# EasyEDA Pro project li-chuang-kai-fa-ban-li-chuang-gd32vw553-kai-fa-ban-b5ed9764.epro

# Schematic 立创 · GD32VW553开发板原理图
Board Name: 立创 · GD32VW553开发板; Create Date: 2025-06-09; Page Name: Core; Project Name: 立创 · GD32VW553开发板; Schematic Name: 立创 · GD32VW553开发板原理图; Update Date: 2025-06-09; Company: 嘉立创EDA; Drawed: 立创开发板; Page Size: A4; Reviewed: 嘉立创EDA
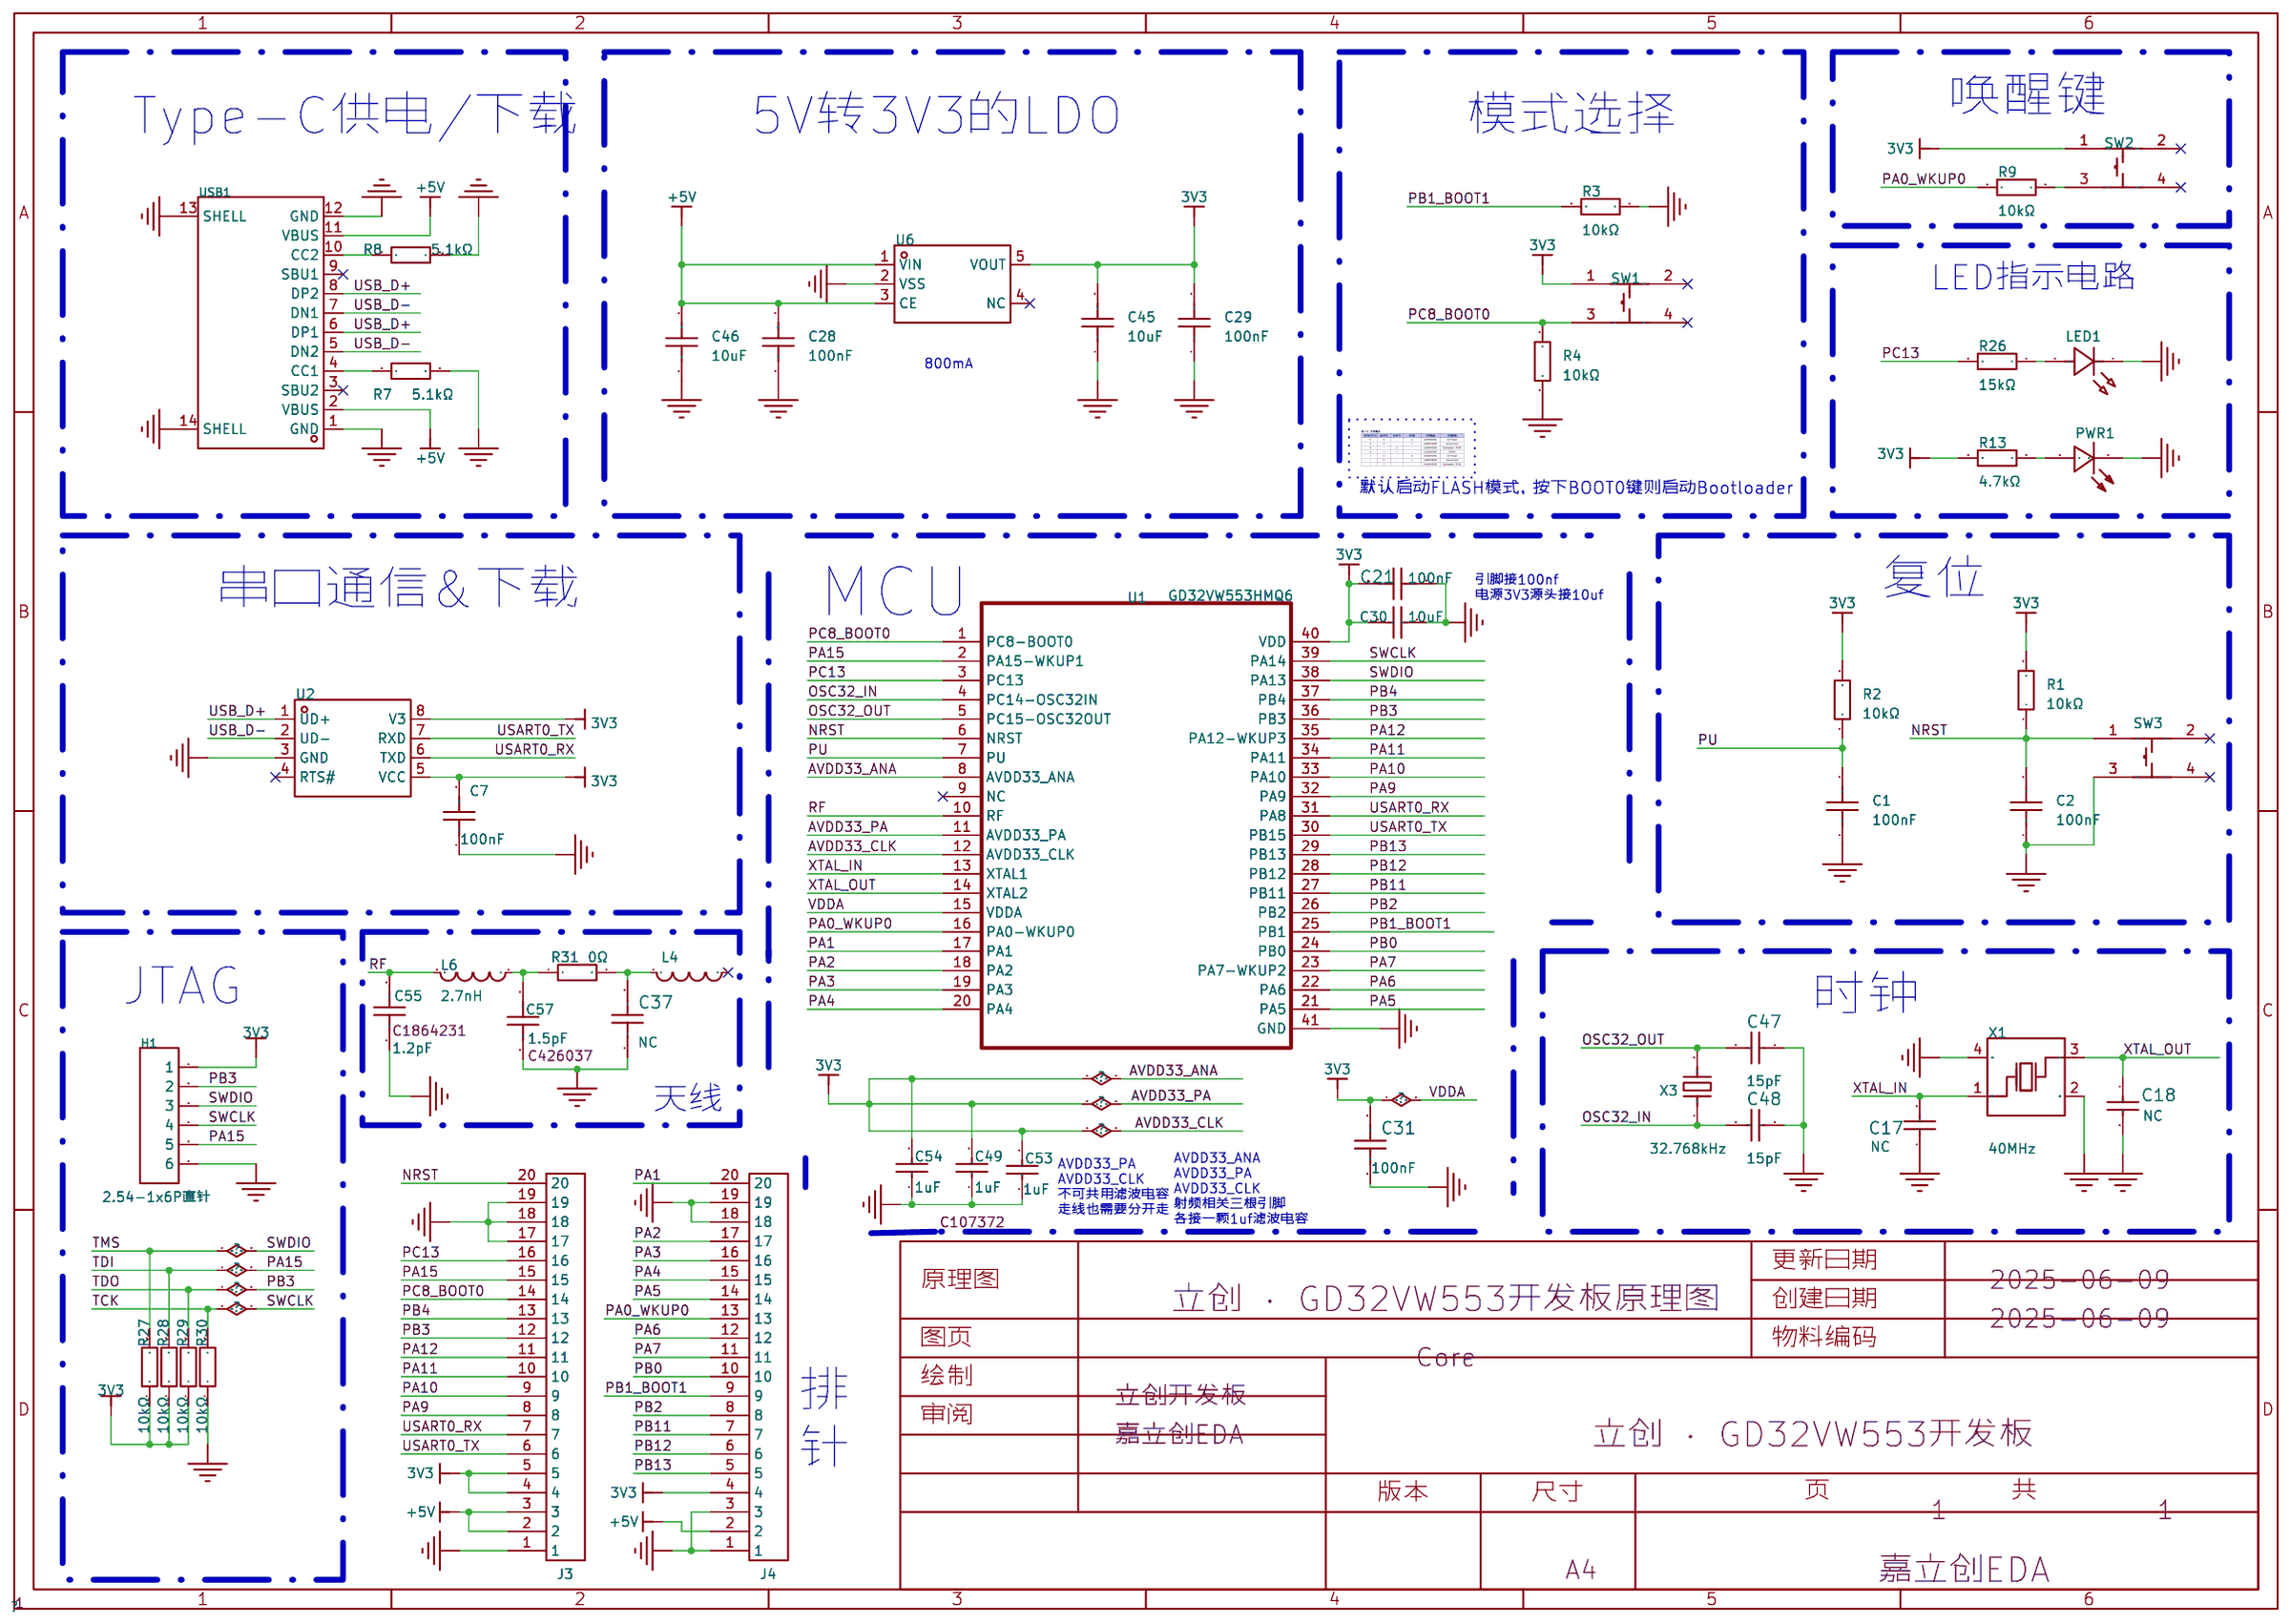
[diagram p0: schematic sheet]

## Parts
C1  100nF  [r0402]
C2  100nF  [r0402]
C7  100nF  [C0603]
C17  NC  [r0402]
C18  NC  [r0402]
C21  100nF  [r0402]
C28  100nF  [r0402]
C29  100nF  [r0402]
C30  10uF  [r0402]
C31  100nF  [r0402]
C37  NC  [C0201]
C45  10uF  [r0402]
C46  10uF  [r0402]
C47  15pF  [r0402]
C48  15pF  [r0402]
C49  1uF  [r0402]
C53  1uF  [r0402]
C54  1uF  [r0402]
C55  1.2pF  [C0201]
C57  1.5pF  [C0201]
H1  2.54-1x6P直针  [HDR-TH_6P-P2.54-V-M-1]
J3  -  [半孔-孔-20p-2.54-1.27-无丝印]
J4  -  [半孔-孔-20p-2.54-1.27-无丝印]
L4  RFANT5220110A2T  [ANT-SMD_L5.2-W2.0]
L6  2.7nH  [L0201]
LED1  XL-1005UGC  [LED0402-RD_GREEN]
PWR1  NCD0402R1  [led0402-rd]
R1  10kΩ  [R0402]
R2  10kΩ  [R0402]
R3  10kΩ  [R0402]
R4  10kΩ  [R0402]
R7  5.1kΩ  [R0603]
R8  5.1kΩ  [R0603]
R9  10kΩ  [R0402]
R13  4.7kΩ  [R0402]
R26  15kΩ  [r0402]
R27  10kΩ  [r0402]
R28  10kΩ  [r0402]
R29  10kΩ  [r0402]
R30  10kΩ  [r0402]
R31  0Ω  [R0201]
SW1  PTS815SJK250SMTRLFS  [SW-SMD_4P-L4.2-W3.3-P2.15-LS5.1]
SW2  PTS815SJK250SMTRLFS  [SW-SMD_4P-L4.2-W3.3-P2.15-LS5.1]
SW3  PTS815SJK250SMTRLFS  [SW-SMD_4P-L4.2-W3.3-P2.15-LS5.1]
U1  GD32VW553HMQ6  [QFN40]
U2  CH340N  [SOP-8_L4.9-W3.9-P1.27-LS6.0-BL]
U6  ME6217C33M5G  [sot-23-5_l3.0-w1.7-p0.95-ls2.8-br]
USB1  TYPE-C 16PIN 2MD(073)  [USB-C-SMD_TYPE-C-6PIN-2MD-073]
X1  40MHz  [CRYSTAL-SMD_4P-L2.5-W2.0-BL]
X3  32.768kHz  [OSC-SMD_L3.2-W1.5]

## Library data of the parts
C1 C2 C28 C29 = CC0402KRX7R7BB104: 容值:100nF;精度:±10%;额定电压:16V;材质(温度系数):X7R;; LCSC Part Name: 100nF ±10% 16V; Supplier Part: C60474; Manufacturer: YAGEO(国巨); Supplier Footprint: 0402; JLCPCB Part Class: Extended Part; Datasheet: https://atta.szlcsc.com/upload/public/pdf/source/20211223/9278FD768280B81DDBEF48FA36411A03.pdf; Supplier: LCSC; Tolerance: ±10%; Voltage Rated: 16V; Temperature Coefficient: X7R
C7 = CC0603KRX7R9BB104: 容值:100nF;精度:±10%;额定电压:50V;材质(温度系数):X7R;; LCSC Part Name: 100nF ±10% 50V; Supplier Part: C14663; Manufacturer: YAGEO(国巨); Supplier Footprint: 0603; JLCPCB Part Class: 基础库; Datasheet: https://atta.szlcsc.com/upload/public/pdf/source/20180910/C282072_33301C7F631E79921B82A8DAC6BCC5B3.pdf; Supplier: LCSC; Tolerance: ±10%; Voltage Rated: 50V; Temperature Coefficient: X7R
C17 C18 = 0402CG100J500NT: 容值:10pF;精度:±5%;额定电压:50V;材质(温度系数):C0G;; LCSC Part Name: 10pF ±5% 50V; Supplier Part: C1545; Manufacturer: FH(风华); Supplier Footprint: 0402; JLCPCB Part Class: Extended Part; Supplier: LCSC; Tolerance: ±5%; Voltage Rated: 50V; Temperature Coefficient: C0G
C21 C31 = GRM155R71H104KE14D: 容值:100nF;精度:±10%;额定电压:50V;材质(温度系数):X7R;; LCSC Part Name: 100nF ±10% 50V; Supplier Part: C77020; Manufacturer: muRata(村田); Supplier Footprint: 0402; JLCPCB Part Class: 扩展库; Datasheet: https://atta.szlcsc.com/upload/public/pdf/source/20180326/C77020_39BD49C951FF1AF0DB1F1FAC5AC1E401.pdf; Supplier: LCSC; Tolerance: ±10%; Voltage Rated: 50V; Temperature Coefficient: X7R
C30 = CL05A106MQ5NUNC: 容值:10uF;精度:±20%;额定电压:6.3V;材质(温度系数):X5R;; LCSC Part Name: 10uF ±20% 6.3V; Supplier Part: C15525; Manufacturer: SAMSUNG(三星); Supplier Footprint: 0402; JLCPCB Part Class: 基础库; Datasheet: https://atta.szlcsc.com/upload/public/pdf/source/20220823/2B02EE04F8F211D38A52DCB16EB6BEBA.pdf; Supplier: LCSC; Tolerance: ±20%; Voltage Rated: 6.3V; Temperature Coefficient: X5R
C37 = GRM0335C1H1R5BA01D: 容值:1.5pF;额定电压:50V;材质(温度系数):C0G;; LCSC Part Name: 1.5pF 50V; Supplier Part: C161414; Manufacturer: muRata(村田); Supplier Footprint: 0201; JLCPCB Part Class: Extended Part; Datasheet: https://atta.szlcsc.com/upload/public/pdf/source/20180122/C161414_15166126300931291272.pdf; Supplier: LCSC; Voltage Rated: 50V; Temperature Coefficient: C0G
C45 C46 = GRM155R61A106ME44D: 容值:10uF;精度:±20%;额定电压:10V;材质(温度系数):X5R;; LCSC Part Name: 10uF ±20% 10V; Supplier Part: C77000; Manufacturer: muRata(村田); Supplier Footprint: 0402; JLCPCB Part Class: 扩展库; Datasheet: https://atta.szlcsc.com/upload/public/pdf/source/20180530/C77000_4866797CFE3A842CD03C597EBD6AE6CD.pdf; Supplier: LCSC; Tolerance: ±20%; Voltage Rated: 10V; Temperature Coefficient: X5R
C47 C48 = 0402CG150J500NT: 容值:15pF;精度:±5%;额定电压:50V;材质(温度系数):C0G;; LCSC Part Name: 15pF ±5% 50V; Supplier Part: C1548; Manufacturer: FH(风华); Supplier Footprint: 0402; Datasheet: https://atta.szlcsc.com/upload/public/pdf/source/20200305/C486355_26A10D38EF8C2A5C37091D0039909270.pdf; Supplier: LCSC; Tolerance: ±5%; Voltage Rated: 50V; Temperature Coefficient: C0G
C49 C53 C54 = CL05A105KQ5NNNC: 容值:1uF;精度:±10%;额定电压:6.3V;材质(温度系数):X5R;; LCSC Part Name: 1uF ±10% 6.3V; Supplier Part: C107372; Manufacturer: SAMSUNG(三星); Supplier Footprint: 0402; JLCPCB Part Class: 扩展库; Datasheet: https://atta.szlcsc.com/upload/public/pdf/source/20170413/1492062766541.pdf; Supplier: LCSC; Tolerance: ±10%; Voltage Rated: 6.3V; Temperature Coefficient: X5R
C55 = GJM0335C1H1R2WB01D: 容值:1.2pF;额定电压:50V;温度系数:C0G;; LCSC Part Name: ±0.05pF 1.2pF 50V; Supplier Part: C1864231; Manufacturer: muRata(村田); Supplier Footprint: 0201; JLCPCB Part Class: 扩展库; Datasheet: https://atta.szlcsc.com/upload/public/pdf/source/20210503/69FEFD345367A6ED6565135E0189A381.pdf; Supplier: LCSC; Voltage Rating: 50V; Temperature Coefficient: C0G
C57 = GJM0335C1E1R5CB01D: 容值:1.5pF;额定电压:25V;温度系数:C0G;; LCSC Part Name: ±0.25pF 1.5pF 25V; Supplier Part: C426037; Manufacturer: muRata(村田); Supplier Footprint: 0201; JLCPCB Part Class: 扩展库; Datasheet: https://atta.szlcsc.com/upload/public/pdf/source/20241220/D0AFAF126C1929700C0BCD7972400352.pdf; Supplier: LCSC; Voltage Rating: 25V; Temperature Coefficient: C0G
H1 = 2.54-1x6P直针: 排数:单排;总PIN位数:6;间距:2.54mm;插针结构:1x6P;行距:-;安装类型:直插;圆针/方针:方针;额定电流:3A;额定电压:-;配合针长度:-;塑高:-;触头材质:黄铜;触头镀层:-;工作温度范围:-40℃~+105℃;颜色:黑色;; LCSC Part Name: 2.54mm 1x6P 直插 方针; Supplier Part: C37208; Manufacturer: BOOMELE(博穆精密); Supplier Footprint: 直插,P=2.54mm; Supplier: LCSC; Number of Rows: 单排; Number of Pins: 6; Pitch: 2.54mm; Pin Structure: 1x6P; Mounting Type: 直插; Circluar Pins/Square Pins: 方针; Current Rating (Max): 3A; Contact Material: 黄铜; Operating Temperature Range: -40℃~+105℃; Color: 黑色
J3 J4 = 半孔-孔-20P-2.54-1.27-无丝印
L4 = RFANT5220110A2T: 天线类型:2.4G天线;中心频点:2.4GHz;带宽:990MHz;峰值增益:2dBi;驻波比:2;极化方式:线性;功率容量:3W;; Supplier Part: C201761; Manufacturer: Walsin(华新科); Supplier Footprint: SMD,2x5.2mm; JLCPCB Part Class: 扩展库; Datasheet: https://atta.szlcsc.com/upload/public/pdf/source/20180726/C201761_362CD995DDC5DCD6FABE652FDC161BB4.pdf; Supplier: LCSC; Antenna Type: 2.4G天线; Central Frequency: 2.4GHz; Bandwidth: 990MHz; Peak Gain: 2dBi; VSWR: 2; Polarization Type: 线性; Impedance: 50Ω; Power capacity: 3W; Operating Temperature: -40℃~+85℃
L6 = LQP03TN2N7B02D: 电感值:2.7nH;精度:-;额定电流:500mA;饱和电流(Isat):-;直流电阻(DCR):200mΩ;; LCSC Part Name: 2.7nH ±0.1nH; Supplier Part: C98043; Manufacturer: muRata(村田); Supplier Footprint: 0201; JLCPCB Part Class: Extended Part; Datasheet: https://atta.szlcsc.com/upload/public/pdf/source/20200107/C157592_7FF58F85BAEF0D918ADFA12AEC0AEBA8.pdf; Supplier: LCSC; Rated Current: 500mA; DC Resistance (DCR): 200mΩ; Q @ Freq: 14@500MHz; Frequency - Self Resonant: 10GHz
LED1 = XL-1005UGC: 发光颜色:翠绿;主波长:516nm;色温:-;功率:80mW;安装方式:正贴;; LCSC Part Name: 正贴; Supplier Part: C2856703; Manufacturer: XINGLIGHT(成兴光); Supplier Footprint: 0402; JLCPCB Part Class: Extended Part; Datasheet: https://atta.szlcsc.com/upload/public/pdf/source/20221102/FF8D6BC2225363A60A01D46BB802F217.pdf; Supplier: LCSC; Emitted Color: 翠绿; Lens Color: 无色透明; Dominant Wavelength: 516nm; Peak Wavelength: 531nm; Forward Current: 25mA; Power Dissipation: 80mW; Viewing Angle: 120°; Mounting Sytle: 正贴; Operating Temperature: -30℃~+85℃
PWR1 = NCD0402R1: 发光颜色:红灯;; LCSC Part Name: 红灯; Supplier Part: C130719; Manufacturer: 国星光电; Supplier Footprint: 0402; JLCPCB Part Class: Extended Part; Datasheet: https://atta.szlcsc.com/upload/public/pdf/source/20200820/C130719_A72EA5A7FEC83C35856EA0453E4EE775.pdf; Supplier: LCSC; Emitted Color: 红灯
R1-R4 R9 = RC0402FR-0710KL: 电阻类型:厚膜电阻;阻值:10kΩ;精度:±1%;功率:62.5mW;; LCSC Part Name: 10kΩ ±1% 62.5mW; Supplier Part: C60490; Manufacturer: YAGEO(国巨); Supplier Footprint: 0402; JLCPCB Part Class: Extended Part; Datasheet: https://atta.szlcsc.com/upload/public/pdf/source/20170606/1496716515432.pdf; Supplier: LCSC; Type: 厚膜电阻; Tolerance: ±1%; Power(Watts): 62.5mW; Temperature Coefficient: ±100ppm/℃; Overload Voltage (Max): 50V; Operating Temperature Range: -55℃~+155℃
R7 R8 = 0603WAF5101T5E: 电阻类型:厚膜电阻;阻值:5.1kΩ;精度:±1%;功率:100mW;; LCSC Part Name: 5.1kΩ ±1% 100mW; Supplier Part: C23186; Manufacturer: UNI-ROYAL(厚声); Supplier Footprint: 0603; JLCPCB Part Class: 基础库; Datasheet: https://atta.szlcsc.com/upload/public/pdf/source/20200306/C422600_1E6D84923E4A46A82E41ADD87F860B5C.pdf; Supplier: LCSC; Type: 厚膜电阻; Tolerance: ±1%; Power(Watts): 100mW; Temperature Coefficient: ±100ppm/℃; Overload Voltage (Max): 75V; Operating Temperature Range: -55℃~+155℃
R13 = 0402WGJ0472TCE: 电阻类型:厚膜电阻;阻值:4.7kΩ;精度:±5%;功率:62.5mW;; LCSC Part Name: 4.7kΩ ±5% 62.5mW; Supplier Part: C25940; Manufacturer: UNI-ROYAL(厚声); Supplier Footprint: 0402; JLCPCB Part Class: 扩展库; Datasheet: https://atta.szlcsc.com/upload/public/pdf/source/20200306/C422600_1E6D84923E4A46A82E41ADD87F860B5C.pdf; Supplier: LCSC; Type: 厚膜电阻; Tolerance: ±5%; Power(Watts): 62.5mW; Temperature Coefficient: ±100ppm/℃; Overload Voltage (Max): 50V; Operating Temperature Range: -55℃~+155℃
R26 = 0402WGF1502TCE: 电阻类型:厚膜电阻;阻值:15kΩ;精度:±1%;功率:62.5mW;; LCSC Part Name: 15kΩ ±1% 62.5mW; Supplier Part: C25756; Manufacturer: UNI-ROYAL(厚声); Supplier Footprint: 0402; JLCPCB Part Class: Basic Part; Datasheet: https://atta.szlcsc.com/upload/public/pdf/source/20200306/C422600_1E6D84923E4A46A82E41ADD87F860B5C.pdf; Supplier: LCSC; Type: 厚膜电阻; Tolerance: ±1%; Power(Watts): 62.5mW; Temperature Coefficient: ±100ppm/℃; Overload Voltage (Max): 50V; Operating Temperature Range: -55℃~+155℃
R27-R30 = 0402WGF1002TCE: 电阻类型:厚膜电阻;阻值:10kΩ;精度:±1%;功率:62.5mW;温度系数:±100ppm/℃;; LCSC Part Name: 厚膜电阻 10kΩ ±1% 62.5mW; Supplier Part: C25744; Manufacturer: UNI-ROYAL(厚声); Supplier Footprint: 0402; Datasheet: https://atta.szlcsc.com/upload/public/pdf/source/20200306/C422600_1E6D84923E4A46A82E41ADD87F860B5C.pdf; Supplier: LCSC; Type: 厚膜电阻; Tolerance: ±1%; Power(Watts): 62.5mW; Temperature Coefficient: ±100ppm/℃; Overload Voltage (Max): 50V; Operating Temperature Range: -55℃~+155℃
R31 = 0201WMF0000TEE: 电阻类型:厚膜电阻;阻值:0Ω;精度:±1%;功率:50mW;最大工作电压:25V;; LCSC Part Name: 0Ω ±1% 50mW 厚膜电阻; Supplier Part: C473473; Manufacturer: UNI-ROYAL(厚声); Supplier Footprint: 0201; JLCPCB Part Class: Extended Part; Datasheet: https://atta.szlcsc.com/upload/public/pdf/source/20200306/C422600_1E6D84923E4A46A82E41ADD87F860B5C.pdf; Supplier: LCSC; Type: 厚膜电阻; Tolerance: ±1%; Power(Watts): 50mW; Overload Voltage (Max): 25V; Operating Temperature Range: -55℃~+155℃
SW1-SW3 = PTS815SJK250SMTRLFS: 操作寿命10万次，使用温度-20°C 至 70°C,尺寸4.20mmx3.20mmx2.50mm，操作力度2.5N; LCSC Part Name: 轻触开关; Supplier Part: C918859; Manufacturer: CK; Supplier Footprint: SMD; JLCPCB Part Class: Extended Part; Datasheet: https://atta.szlcsc.com/upload/public/pdf/source/20190916/C411883_4F77F16E1D8E48DC707D8949CEE7CF80.pdf; Supplier: LCSC
U1 = GD32VW553: 主控MCU
U2 = CH340N: LCSC Part Name: USB转串口芯片 CH340; Supplier Part: C2977777; Manufacturer: WCH(南京沁恒); Supplier Footprint: SOP-8; JLCPCB Part Class: 扩展库; Datasheet: https://atta.szlcsc.com/upload/public/pdf/source/20220223/82A45E4FF89B3EDCAD50B354450A7EF4.pdf; Supplier: LCSC
U6 = ME6217C33M5G: 输出类型:固定;输出极性:正;最大输入电压:7V;输出电压:3.3V;输出电流:800mA;电源纹波抑制比(PSRR):65dB@(1kHz);; Supplier Part: C427602; Manufacturer: MICRONE(南京微盟); Supplier Footprint: SOT-23-5; JLCPCB Part Class: 扩展库; Datasheet: https://atta.szlcsc.com/upload/public/pdf/source/20190910/C427602_D4B9162A2E9D9EF57C60010DFDECEF37.pdf; Supplier: LCSC; Output Type: 固定; Output Polarity: 正; Number of Outputs: 1; Maximum Input Voltage: 7V; Output Voltage: 3.3V; Dropout Voltage: 180mV@(300mA); Output Current: 800mA; Power Supply Rejection Ratio (PSRR): 65dB@(1kHz)
USB1 = TYPE-C 16PIN 2MD(073): 连接器类型:Type-C;标准:-;公母:母座;触点数量:16;端口数量:1;安装方式:卧贴;额定电流 - 电源:5A;工作温度范围:-25℃~+85℃;; LCSC Part Name: TYPE-C母座 16P 4脚插件带定位柱 不锈钢外壳 2次模顶; Supplier Part: C2765186; Manufacturer: SHOU HAN(首韩); Supplier Footprint: SMD; JLCPCB Part Class: 扩展库; Supplier: LCSC; Connector Type: Type-C; Gender: 母座; Number of Contacts: 16; Number of Ports: 1; Mounting Style: 卧贴; Current Rating - Power (Max): 5A; Operating Temperature Range: -25℃~+85℃
X1 = S2240000101050: 频率:40MHz;频率公差:±10ppm;负载电容:10pF;; LCSC Part Name: 40MHz ±10ppm 内置负载电容:10pF; Supplier Part: C426970; Manufacturer: JGHC(晶光华); Supplier Footprint: SMD2520-4P; JLCPCB Part Class: Extended Part; Datasheet: https://atta.szlcsc.com/upload/public/pdf/source/20191012/C426970_2771A21F294CF3AF1716602854856198.pdf; Supplier: LCSC; Crystal Type: 贴片无源晶振; Frequency Tolerance: ±10ppm; Load Capacitance: 10pF; Equivalent Series Resistance (ESR): 50Ω; Operating Temperature: -40℃~+85℃
X3 = X321532768KGD2SI: 频率:32.768kHz;频率公差:±20ppm;负载电容:12.5pF;; LCSC Part Name: 32.768kHz ±20ppm 12.5pF YST310S; Supplier Part: C620155; Manufacturer: YXC(扬兴晶振); Supplier Footprint: SMD3215-2P; Datasheet: https://atta.szlcsc.com/upload/public/pdf/source/20210329/C620155_E5A74FC0D27C5E9015A8D75DE9484FEA.pdf; Supplier: LCSC; Crystal Type: 贴片无源晶振; Frequency Tolerance: ±20ppm; Load Capacitance: 12.5pF; Operating Temperature: -40℃~+85℃

## Nets
3V3: C7.2 C21.1 C29.2 C30.2 C31.2 C45.2 C49.2 C53.2 C54.2 H1.1 J3.4 J3.5 J4.4 R1.2 R2.2 R13.2 R27.1 R28.1 R29.1 SW1.1 SW2.1 U1.8(AVDD33_ANA) U1.11(AVDD33_PA) U1.12(AVDD33_CLK) U1.15(VDDA) U1.40(VDD) U2.5(VCC) U2.8(V3) U6.5(VOUT)
+5V: C28.2 C46.2 J3.2 J3.3 J4.2 U6.1(VIN) U6.3(CE) USB1.2(VBUS) USB1.11(VBUS)
GND: C1.1 C2.1 C7.1 C17.1 C18.2 C21.2 C28.1 C29.1 C30.1 C31.1 C37.1 C45.1 C46.1 C47.2 C48.2 C49.1 C53.1 C54.1 C55.1 C57.1 H1.6 J3.1 J3.17 J3.18 J3.19 J4.1 J4.3 J4.18 J4.19 LED1.1(K) PWR1.1(K) R3.1 R4.2 R7.2 R8.2 R30.1 SW3.3 U1.41(GND) U2.3(GND) U6.2(VSS) USB1.1(GND) USB1.12(GND) USB1.13(SHELL) USB1.14(SHELL) X1.2(GND) X1.4(GND)
NRST: C2.2 J3.20 R1.1 SW3.1 U1.6(NRST)
OSC32_IN: C48.1 U1.4(PC14-OSC32IN) X3.1
OSC32_OUT: C47.1 U1.5(PC15-OSC32OUT) X3.2
PA0_WKUP0: J4.13 R9.1 U1.16(PA0-WKUP0)
PA1: J4.20 U1.17(PA1)
PA2: J4.17 U1.18(PA2)
PA3: J4.16 U1.19(PA3)
PA4: J4.15 U1.20(PA4)
PA5: J4.14 U1.21(PA5)
PA6: J4.12 U1.22(PA6)
PA7: J4.11 U1.23(PA7-WKUP2)
PA9: J3.8 U1.32(PA9)
PA10: J3.9 U1.33(PA10)
PA11: J3.10 U1.34(PA11)
PA12: J3.11 U1.35(PA12-WKUP3)
PA15: H1.5 J3.15 R28.2 U1.2(PA15-WKUP1)
PB0: J4.10 U1.24(PB0)
PB1_BOOT1: J4.9 R3.2 U1.25(PB1)
PB2: J4.8 U1.26(PB2)
PB3: H1.2 J3.12 R29.2 U1.36(PB3)
PB4: J3.13 U1.37(PB4)
PB11: J4.7 U1.27(PB11)
PB12: J4.6 U1.28(PB12)
PB13: J4.5 U1.29(PB13)
PC8_BOOT0: J3.14 R4.1 SW1.3 U1.1(PC8-BOOT0)
PC13: J3.16 R26.2 U1.3(PC13)
PU: C1.2 R2.1 U1.7(PU)
RF: C55.2 L6.2 U1.10(RF)
SWCLK: H1.4 R30.2 U1.39(PA14)
SWDIO: H1.3 R27.2 U1.38(PA13)
USART0_RX: J3.7 U1.31(PA8) U2.6(TXD)
USART0_TX: J3.6 U1.30(PB15) U2.7(RXD)
USB_D+: U2.1(UD+) USB1.6(DP1) USB1.8(DP2)
USB_D-: U2.2(UD-) USB1.5(DN2) USB1.7(DN1)
XTAL_IN: C17.2 U1.13(XTAL1) X1.1(OSC1)
XTAL_OUT: C18.1 U1.14(XTAL2) X1.3(OSC2)
$1N2903: R8.1 USB1.10(CC2)
$1N2915: R7.1 USB1.4(CC1)
$1N28047: PWR1.2(A) R13.1
$1N28050: LED1.2(A) R26.1
$1N31252: R9.2 SW2.3
$1N47923: C37.2 L4.1 R31.2
$1N51376: C57.2 L6.1 R31.1

Not connected (* = marked no-connect by the designer): L4 2*; SW1 2* 4*; SW2 2* 4*; SW3 2* 4*; U1 9(NC)*; U2 4(RTS#)*; U6 4(NC)*; USB1 3(SBU2)* 9(SBU1)*

## Notes on the sheet
- 唤醒键
- Type-C供电/下载
- 5V转3V3的LDO
- 模式选择
- LED指示电路
- 800mA
- 默认启动FLASH模式，按下BOOT0键则启动Bootloader
- 引脚接100nf
  电源3V3源头接10uf
- 串口通信&下载
- 复位
- MCU
- JTAG
- 时钟
- 天线
- AVDD33_PA
  AVDD33_CLK
  不可共用滤波电容
  走线也需要分开走
- AVDD33_ANA
  AVDD33_PA
  AVDD33_CLK
  射频相关三根引脚
  各接一颗1uf滤波电容
- 排
  针

# Board 立创 · GD32VW553开发板_PCB
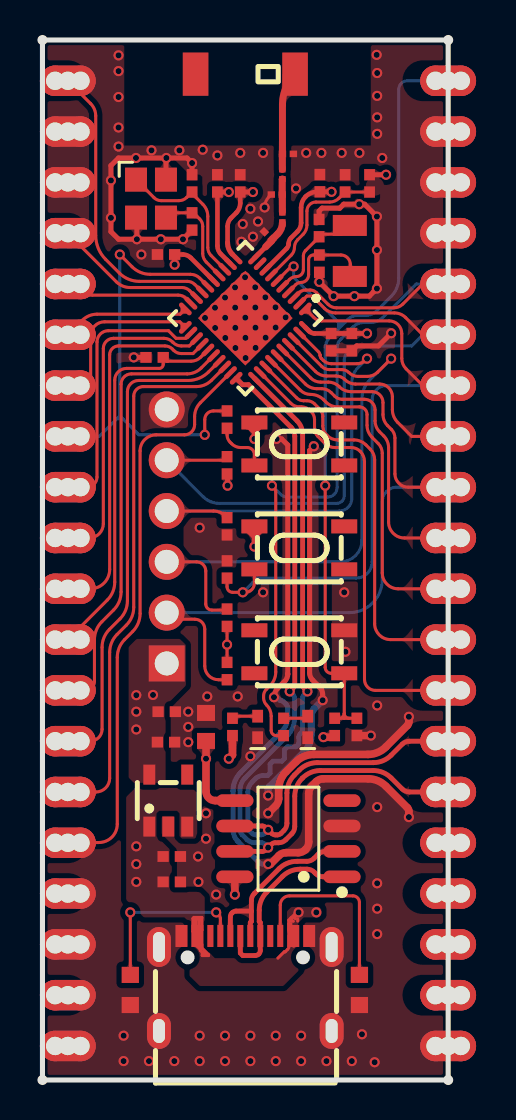
[diagram p1: board, top side]
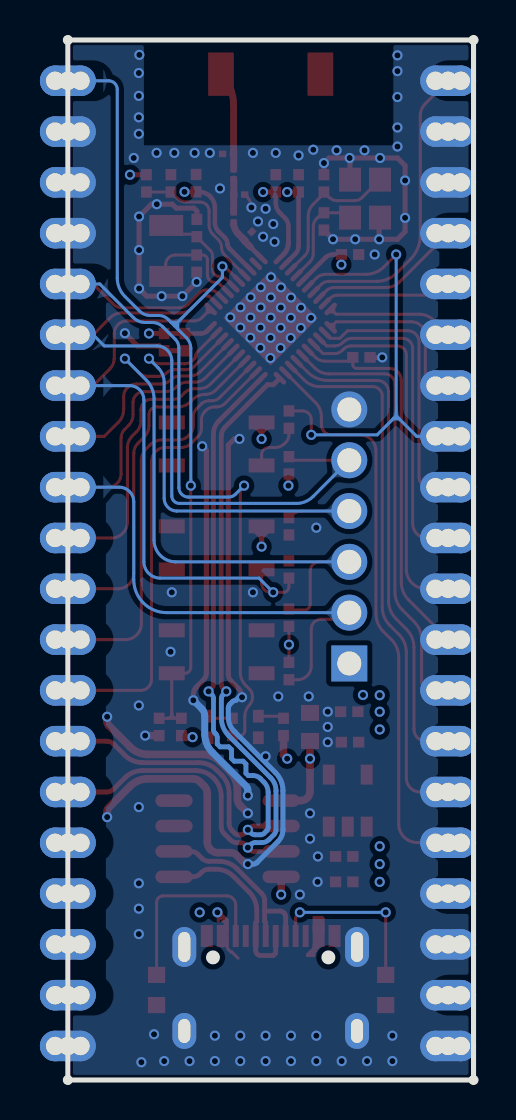
[diagram p2: board, bottom side, seen from below]

Outline 20.32 x 52 mm; copper layers: Top Layer, GND, POWER, Bottom Layer. Coordinates in mm from the lower left corner of the outline.
Outline path: 0,52 0,0 0,0 0,0 20.32,0 20.32,52 0,52
Stack: Top Layer 0.035mm 外层铜厚1oz / Dielectric1 0.2104mm 7628 RC49% 8.6mil / GND 0.0152mm 内层铜厚 / Dielectric2 1.065mm 1.1mm H/HOZ Copper / POWER 0.0152mm 内层铜厚 / Dielectric3 0.2104mm 7628 RC49% 8.6mil / Bottom Layer 0.035mm 外层铜厚1oz

## Design rules (mm)
net USB_D-: DP1
net USB_D+: DP1
net USART0_TX: DP2
net USART0_RX: DP2
spacing copperThickness1oz (default): track to track 0.102, other pairs 0 to 0.3
spacing copperThickness2oz: track to track 0.203, other pairs 0.152 to 0.3
spacing Plane_innerPlane: track to track 0.102, other pairs 0 to 0.3
spacing Copper_copperRegion: track to track 0.102, other pairs 0 to 0.3
track width copperThickness1oz (default): min 0.152, default 0.152, max 2.54
track width copperThickness2oz: min 0.203, default 0.254, max 2.54
differential pair differentialPair (default): width min 0.241, default 0.241, max 0.241; gap min 0.152, default 0.152
region e1 uses Copper_copperRegion
pour e1160 uses Copper_copperRegion
pour e1166 uses Copper_copperRegion
pour e1168 uses Copper_copperRegion
pour e1170 uses Copper_copperRegion
pour e1189 uses Copper_copperRegion

## Placement (name value [footprint] x y rotation side)
C1  100nF  [r0402]  15.16 44.83 270 top
C2  100nF  [r0402]  15.75 17.65 90 top
C7  100nF  [C0603]  8.19 17.65 270 top
C17  NC  [r0402]  7.49 44.83 270 top
C18  NC  [r0402]  7.49 42.93 270 top
C21  100nF  [r0402]  15.49 36.89 270 top
C28  100nF  [r0402]  6.48 9.91 180 top
C29  100nF  [r0402]  6.22 18.42 180 top
C30  10uF  [r0402]  14.46 36.89 90 top
C31  100nF  [r0402]  6.19 41.28 0 top
C37  NC  [C0201]  12.29 46.3 180 top
C45  10uF  [r0402]  6.19 16.89 180 top
C46  10uF  [r0402]  6.48 11.18 180 top
C47  15pF  [r0402]  13.86 42.6 90 top
C48  15pF  [r0402]  13.87 40.82 270 top
C49  1uF  [r0402]  9.91 44.83 270 top
C53  1uF  [r0402]  8.76 44.83 270 top
C54  1uF  [r0402]  13.89 44.84 270 top
C55  1.2pF  [C0201]  11.3 42.22 315 top
C57  1.5pF  [C0201]  11.74 44.27 0 top
H1  2.54-1x6P直针  [hdr-th_6p-p2.54-v-m-1]  6.22 27.18 90 top
J3  -  [半孔-孔-20p-2.54-1.27-无丝印]  19.69 25.83 90 top
J4  -  [半孔-孔-20p-2.54-1.27-无丝印]  0.64 25.83 90 top
L4  RFANT5220110A2T  [ant-smd_l5.2-w2.0]  10.16 50.29 180 top
L6  2.7nH  [L0201]  12.01 43.13 270 top
LED1  XL-1005UGC  [LED0402-RD_GREEN]  13.29 17.65 90 top
PWR1  NCD0402R1  [led0402-rd]  10.78 17.65 90 top
R1  10kΩ  [R0402]  14.63 17.65 270 top
R2  10kΩ  [R0402]  16.38 44.83 90 top
R3  10kΩ  [R0402]  5.62 36.13 0 top
R4  10kΩ  [R0402]  9.25 25.53 90 top
R7  5.1kΩ  [R0603]  4.4 4.5 270 top
R8  5.1kΩ  [R0603]  15.88 4.5 270 top
R9  10kΩ  [R0402]  9.25 33.02 270 top
R13  4.7kΩ  [R0402]  9.52 17.65 270 top
R26  15kΩ  [r0402]  12.08 17.65 270 top
R27  10kΩ  [r0402]  9.25 23.11 90 top
R28  10kΩ  [r0402]  9.25 30.73 90 top
R29  10kΩ  [r0402]  9.25 20.45 270 top
R30  10kΩ  [r0402]  9.25 27.69 90 top
R31  0Ω  [R0201]  12.01 45.29 90 top
SW1  PTS815SJK250SMTRLFS  [SW-SMD_4P-L4.2-W3.3-P2.15-LS5.1]  12.87 26.61 0 top
SW2  PTS815SJK250SMTRLFS  [SW-SMD_4P-L4.2-W3.3-P2.15-LS5.1]  12.87 31.8 0 top
SW3  PTS815SJK250SMTRLFS  [SW-SMD_4P-L4.2-W3.3-P2.15-LS5.1]  12.87 21.41 180 top
U1  GD32VW553HMQ6  [qfn40]  10.16 38.09 225 top
U2  CH340N  [SOP-8_L4.9-W3.9-P1.27-LS6.0-BL]  12.32 12.07 90 top
U6  ME6217C33M5G  [sot-23-5_l3.0-w1.7-p0.95-ls2.8-br]  6.3 13.97 270 top
USB1  TYPE-C 16PIN 2MD(073)  [USB-C-SMD_TYPE-C-6PIN-2MD-073]  10.16 4.83 0 top
X1  40MHz  [crystal-smd_4p-l2.5-w2.0-bl]  5.44 44.07 270 top
X3  32.768kHz  [osc-smd_l3.2-w1.5]  15.39 41.45 90 top

## Footprints (pads in the part's own frame, mm; a bottom-side part is the same pattern mirrored in y, then rotated)
ant-smd_l5.2-w2.0
  rect 1.282x2.16 smd: 1(-2.491,0) 2(2.491,0)
C0201
  rect 0.368x0.324 smd: 1(-0.275,0) 2(0.275,0)
C0603
  rect 0.8x0.9 smd: 1(-0.7,0) 2(0.7,0)
crystal-smd_4p-l2.5-w2.0-bl
  rect 1.2x1.1 smd: 1(-0.95,-0.75) 2(0.95,-0.75) 3(0.95,0.75) 4(-0.95,0.75)
hdr-th_6p-p2.54-v-m-1
  rect 1.8x1.8 hole 1.2: 1(-6.35,0)
  round 1.8 hole 1.2: 2(-3.81,0) 3(-1.27,0) 4(1.27,0) 5(3.81,0) 6(6.35,0)
L0201
  rect 0.368x0.324 smd: 1(-0.275,0) 2(0.275,0)
led0402-rd
  rect 0.636x0.54 smd: 1(-0.538,0) 2(0.538,0)
LED0402-RD_GREEN
  rect 0.636x0.54 smd: 1(-0.538,0) 2(0.538,0)
osc-smd_l3.2-w1.5
  rect 1.05x1.7 smd: 1(-1.275,0) 2(1.275,0)
qfn40
  oval 0.8x0.24 smd: 1(-2.45,1.8) 2(-2.45,1.4) 3(-2.45,1) 4(-2.45,0.6) 5(-2.45,0.2) 6(-2.45,-0.2) 7(-2.45,-0.6) 8(-2.45,-1) 9(-2.45,-1.4) 10(-2.45,-1.8) 21(2.45,-1.8) 22(2.45,-1.4) 23(2.45,-1) 24(2.45,-0.6) 25(2.45,-0.2) 26(2.45,0.2) 27(2.45,0.6) 28(2.45,1) 29(2.45,1.4) 30(2.45,1.8)
  oval 0.24x0.8 smd: 11(-1.8,-2.45) 12(-1.399,-2.45) 13(-1.001,-2.45) 14(-0.6,-2.45) 15(-0.201,-2.45) 16(0.201,-2.45) 17(0.6,-2.45) 18(1.001,-2.45) 19(1.399,-2.45) 20(1.8,-2.45) 31(1.8,2.45) 32(1.399,2.45) 33(1.001,2.45) 34(0.6,2.45) 35(0.201,2.45) 36(-0.201,2.45) 37(-0.6,2.45) 38(-1.001,2.45) 39(-1.399,2.45) 40(-1.8,2.45)
  rect 3.35x3.35 smd: 41(0,0)
R0201
  rect 0.303x0.324 smd: 1(-0.241,0) 2(0.241,0)
r0402
  rect 0.566x0.54 smd: 1(-0.433,0) 2(0.433,0)
R0402
  rect 0.566x0.54 smd: 1(-0.433,0) 2(0.433,0)
R0603
  rect 0.806x0.864 smd: 1(-0.753,0) 2(0.753,0)
SOP-8_L4.9-W3.9-P1.27-LS6.0-BL
  oval 0.63x1.865 smd: 1(-1.905,-2.683) 2(-0.635,-2.683) 3(0.635,-2.683) 4(1.905,-2.683) 5(1.905,2.683) 6(0.635,2.683) 7(-0.635,2.683) 8(-1.905,2.683)
sot-23-5_l3.0-w1.7-p0.95-ls2.8-br
  rect 1x0.6 smd: 1(1.3,-0.95) 2(1.3,0) 3(1.3,0.95) 4(-1.3,0.95) 5(-1.3,-0.95)
SW-SMD_4P-L4.2-W3.3-P2.15-LS5.1
  rect 1.3x0.7 smd: 1(-2.25,1.075) 2(2.25,1.075) 3(-2.25,-1.075) 4(2.25,-1.075)
USB-C-SMD_TYPE-C-6PIN-2MD-073
  rect 0.6x1.1 smd: 1(-3.2,2.375) 2(-2.4,2.375) 11(2.4,2.375) 12(3.2,2.375)
  rect 0.3x1.1 smd: 3(-1.75,2.375) 4(-1.25,2.375) 5(-0.75,2.375) 6(-0.25,2.375) 7(0.25,2.375) 8(0.75,2.375) 9(1.25,2.375) 10(1.75,2.375)
  oval 1.2x2 hole 0.6x1.5: 13(-4.325,1.825) 14(4.325,1.825)
  oval 1.2x1.8 hole 0.6x1.2: 13(-4.325,-2.375) 14(4.325,-2.375)
半孔-孔-20p-2.54-1.27-无丝印
  round 1.524 hole 0.914: 1(-24.13,0) 1(-24.13,-1.27) 2(-21.59,0) 2(-21.59,-1.27) 3(-19.05,0) 3(-19.05,-1.27) 4(-16.51,0) 4(-16.51,-1.27) 5(-13.97,0) 5(-13.97,-1.27) 6(-11.43,0) 6(-11.43,-1.27) 7(-8.89,0) 7(-8.89,-1.27) 8(-6.35,0) 8(-6.35,-1.27) 9(-3.81,0) 9(-3.81,-1.27) 10(-1.27,0) 10(-1.27,-1.27) 11(1.27,0) 11(1.27,-1.27) 12(3.81,0) 12(3.81,-1.27) 13(6.35,0) 13(6.35,-1.27) 14(8.89,0) 14(8.89,-1.27) 15(11.43,0) 15(11.43,-1.27) 16(13.97,0) 16(13.97,-1.27) 17(16.51,0) 17(16.51,-1.27) 18(19.05,0) 18(19.05,-1.27) 19(21.59,0) 19(21.59,-1.27) 20(24.13,0) 20(24.13,-1.27)
  oval 1.524x2.794 hole 0.914: 1(-24.13,-0.635) 2(-21.59,-0.635) 3(-19.05,-0.635) 4(-16.51,-0.635) 5(-13.97,-0.635) 6(-11.43,-0.635) 7(-8.89,-0.635) 8(-6.35,-0.635) 9(-3.81,-0.635) 10(-1.27,-0.635) 11(1.27,-0.635) 12(3.81,-0.635) 13(6.35,-0.635) 14(8.89,-0.635) 15(11.43,-0.635) 16(13.97,-0.635) 17(16.51,-0.635) 18(19.05,-0.635) 19(21.59,-0.635) 20(24.13,-0.635)

## Nets
As in the schematic.

Pads without a net: L4 2; SW1 2 4; SW2 2 4; SW3 2 4; U1 9; U2 4; U6 4; USB1 3 9

## Via types
v1: diameter 0.508, hole 0.305, Top Layer to Bottom Layer, 156 vias

## Routing (per net, layer and track width the routed paths; a pad name or vN(x,y) marks a point on that pad's centre or on a via; arc(x,y) is an arc through that point)
3V3: length 160.9
  Top Layer w0.152: 9.51,41.29 U1.11 ; R29.1 v1(9.25,21.77) 9.25,22.68
  Top Layer w0.229: 13.89,44.41 13.76,44.41 arc(13.45,44.35) 13.18,44.17 arc(13.01,43.92) 12.95,43.62 12.95,42.86 arc(12.91,42.63) 12.78,42.43 12.44,42.1 arc(12.36,41.97) 12.33,41.82 arc(12.33,41.8) 12.33,41.79 arc(12.3,41.67) 12.23,41.58 U1.8 ; C49.2 9.91,43.84 arc(9.86,43.58) 9.71,43.37 9.44,43.1 arc(9.32,42.91) 9.27,42.68 9.27,41.87 ; U1.12 8.93,41.3 arc(8.81,41.49) 8.76,41.71 C53.2 ; U1.15 7.43,41.11 arc(7.24,41.23) 7.03,41.28 C31.2 ; C30.2 13.64,37.33 arc(13.49,37.36) 13.36,37.44 U1.40
  Top Layer w0.241: v1(16.26,37.33) C21.1 C30.2
  Top Layer w0.254: v1(10.62,26.67) 10.62,27.15 ; 10.62,27.15 10.29,27.48 10.17,27.48 ; 10.62,27.15 10.95,27.49 11.06,27.49 ; 10.62,27.15 SW1.1 ; C31.2 v1(6.62,40.77) ; 10.62,32.39 10.9,32.67 11.07,32.67 ; 10.62,32.39 v1(10.62,32.05) ; 10.62,32.39 10.35,32.66 10.25,32.66 ; 10.62,32.39 SW2.1 ; v1(9.27,29.72) 9.27,30.28 R28.1 ; C53.2 v1(9.33,44.4) ; R2.2 v1(17.21,45.26) ; 13.89,44.41 v1(14.48,44.41) ; C49.2 v1(10.54,44.4) ; 9.27,41.87 arc(9.33,41.55) 9.51,41.29
  Top Layer w0.381: R13.2 9.52,16.25 v1(9.33,16.07) ; R1.2 14.56,17.14 v1(14.07,17.14) ; U2.5 8.65,13.97 arc(8.33,14.1) 8.19,14.43 v1(8.19,16.07) C7.2 ; U2.8 v1(9.64,9.27)
  POWER w0.381: 10.03,45.21 10.2,45.21 10.54,44.87 ; 13.82,15.73 13.34,15.24 ; 13.82,15.73 14.07,15.98 v1(14.07,17.14) ; 13.82,15.73 13.82,14.81 13.8,14.78 ; 9.33,15.76 9.33,15.25 9.34,15.24 ; 9.33,15.76 9.85,15.24 ; 9.33,15.76 9.33,15.79 ; 14.48,44.87 14.48,45.4 14.48,45.41 ; 14.48,44.87 14.14,45.21 13.97,45.21 ; 14.48,44.87 v1(14.48,44.41) ; 14.48,44.87 14.99,45.38 14.99,45.41 ; 14.43,30.73 10.29,30.73 v1(9.27,29.72) ; 14.43,30.73 14.99,30.18 ; 14.43,30.73 14.99,30.73 ; 14.43,30.73 14.99,31.29 ; 5.08,19.18 5.46,19.18 v1(5.54,19.25) ; 9.25,21.47 8.86,21.08 ; 9.25,21.47 9.63,21.08 ; 9.25,21.47 v1(9.25,21.77) ; 9.25,21.47 9.25,20.84 9.23,20.83 ; 9.33,44.8 9.33,45.15 9.27,45.21 ; 9.33,44.8 9.73,45.2 9.73,45.41 ; 9.33,44.8 8.97,45.17 8.97,45.41 ; 9.33,44.8 v1(9.33,44.4) ; 16.92,44.97 16.4,44.97 16.23,44.81 ; 16.92,44.97 16.51,44.56 16.48,44.56 ; 16.92,44.97 16.92,44.24 16.86,44.18 ; 16.92,44.97 v1(17.21,45.26) ; 5.11,19.72 5.11,19.68 v1(5.54,19.25) ; 14.55,32.7 14.99,32.26 ; 14.55,32.7 15.24,32.7 ; 14.55,32.7 11.26,32.7 v1(10.62,32.05) ; 14.55,32.7 14.99,33.13 ; 9.64,14.66 9.64,15.24 9.64,15.24 ; 9.64,14.66 10.21,15.24 ; 9.64,14.66 9.64,14.63 ; v1(5.54,19.25) 5.54,20.14 ; v1(8.19,16.07) 8.19,15.71 ; 8.19,15.71 8.66,15.24 ; 8.19,15.71 7.72,15.24 ; 8.19,15.71 8.19,15.25 8.2,15.24 ; v1(10.62,26.67) 13.12,26.67 ; 13.12,26.67 13.81,26.67 13.84,26.64 ; 13.12,26.67 13.59,26.2 ; 13.12,26.67 13.73,27.28 ; 9.33,15.79 8.79,15.24 ; 9.33,15.79 v1(9.33,16.07) ; 10.54,44.87 v1(10.54,44.4) ; 10.54,44.87 11.05,45.38 11.05,45.41 ; 10.54,44.87 10.54,45.4 10.55,45.41 ; v1(9.64,9.27) 9.64,14.63 ; 9.64,14.63 9.03,15.24
  POWER w0.762: 19.05,9.32 19.05,11.86 16.71,11.86 13.34,15.24 4.7,15.24 ; 15.24,36.07 15.24,36.31 v1(16.26,37.33) 17.61,38.68 17.61,43.43 16.86,44.18 16.48,44.56 16.23,44.81 15.63,45.41 8.45,45.41 8,44.96 8,41.78 6.99,40.77 v1(6.62,40.77) ; J4.4 3.3,11.35 3.3,13.84 4.7,15.24 ; 4.7,15.24 v1(4.7,17.53) v1(4.7,18.42) v1(4.7,19.24) 4.7,19.3 5.11,19.72 5.54,20.14 H1.1
  POWER w1.016: H1.1 12.45,20.83 13.84,22.23 13.84,26.92 15.24,28.32 15.24,36.07
+5V: length 48.7
  Top Layer w0.152: 12.78,8.34 12.66,8.22 12.66,8.06 ; 7.71,6.71 7.72,6.71 7.91,6.52 7.91,6.48 8,6.38 ; 12.57,8.15 12.49,8.06 12.45,8.1 ; 12.45,8.1 12.34,7.99 12.34,7.8 ; 12.45,8.1 12.73,8.38 12.8,8.38 ; 7.93,6.81 7.93,6.66 7.98,6.6 ; 7.97,7.48 7.98,7.5 7.98,8.13 7.59,8.13 ; 7.59,7.37 7.76,7.2 ; 7.59,7.37 7.53,7.43 7.53,8.07 7.59,8.13 ; 7.59,7.37 7.59,8.13 ; 12.35,7.2 12.35,6.71 arc(12.33,6.61) 12.28,6.53 12.16,6.41 12.11,6.41 11.79,6.09 ; 12.59,6.69 12.57,6.69 ; 7.98,6.6 7.98,6.77 ; 7.98,6.6 8.32,6.27 8.32,6.22 8,6.22 8,6.38 ; 12.34,7.8 12.45,7.8 ; 12.34,7.8 12.34,7.53 arc(12.36,7.43) 12.41,7.35 12.56,7.2 ; 12.57,7.94 12.45,7.94 ; 8.14,6.3 8.06,6.38 8,6.38 ; 7.71,7.65 7.71,8.05 7.71,8.05 7.9,8.05 ; 7.9,8.05 7.91,8.06 ; 7.9,8.05 7.86,8.01 7.86,7.66 ; 12.78,7.94 12.78,8.06
  POWER w1.016: 8.91,6.88 7.03,8.76 5.84,8.76 v1(4.7,9.91) v1(4.7,10.8) v1(4.7,11.68) ; 8.91,6.88 8.91,6.07 ; 8.91,6.88 9.71,6.88 ; 8.91,5.06 8.09,4.24 ; 8.91,5.06 8.91,6.07 ; 8.91,5.06 8.91,4.24 ; 8.91,5.06 9.73,4.24 ; 8.09,4.24 8.91,4.24 ; 8.09,4.24 J4.2 ; 8.91,6.07 9.71,6.88 ; 8.91,4.24 9.73,4.24 ; 9.73,4.24 19.05,4.24 19.05,6.78 ; 9.71,6.88 11.22,8.38 v1(12.83,8.38) v1(13.72,8.38)
GND: length 95.5
  Top Layer w0.152: C57.1 11.34,44.16 arc(11.18,43.91) v1(11.13,43.63)
  Top Layer w0.254: X1.2 4.73,43.08 v1(4.73,42.04) ; R3.1 v1(4.57,36.13) ; C30.1 C21.2 15.74,36.7 16.83,36.7 v1(17.46,37.34) ; X1.4 6.19,46.08 v1(6.21,46.1) ; v1(13.59,31.69) 13.38,31.48 13.38,20.36 arc(13.42,20.16) 13.53,20 13.88,19.64 arc(13.99,19.48) 14.03,19.28 v1(14.03,18.99) ; v1(6.21,46.1) v1(4.68,46.1) 3.81,46.1 3.43,45.72 v1(3.43,44.98) v1(3.43,43.11) 3.43,42.42 3.81,42.04 v1(4.73,42.04) ; v1(6.21,46.1) 7.24,46.1 v1(7.49,45.85) C17.1 ; 16.75,42.96 v1(16.75,41.5) 16.75,39.78 arc(16.71,39.59) 16.6,39.42 ; v1(4.73,42.04) v1(5.93,42.04) v1(7.04,42.04) 7.49,42.49 ; 16.6,39.42 v1(16.75,39.57) ; 16.6,39.42 16.37,39.19 v1(15.62,39.19) v1(14.58,39.19) v1(13.87,39.9) C48.2 ; v1(11.72,32.05) 11.98,32.05 12.28,31.75 12.28,20.3 arc(12.28,20.3) 12.29,20.3 arc(12.25,20.1) 12.14,19.94 11.77,19.57 arc(11.66,19.41) 11.62,19.21 11.59,19.19 v1(11.59,19.14) ; 13.86,43.03 13.86,43.45 14,43.59 14.89,43.59 15.09,43.79 v1(15.86,43.79) 16.14,43.79 v1(16.75,43.17)
  Top Layer w0.381: v1(18.35,13.14) 18.35,13.43 arc(18.33,13.53) 18.28,13.61 17.2,14.69 arc(16.79,14.96) 16.3,15.06 14.06,15.06 arc(13.87,15.02) 13.71,14.91 13.48,14.69 arc(13.37,14.53) 13.34,14.33 13.34,11.89 arc(13.3,11.7) 13.19,11.54 13.17,11.52 arc(13,11.41) 12.81,11.37 12.2,11.37 arc(12.01,11.33) 11.84,11.22 11.42,10.8 v1(11.3,10.8) ; v1(11.3,13.34) 11.68,13.71 arc(11.79,13.88) 11.83,14.07 11.83,14.52 arc(11.93,15.01) 12.2,15.42 12.69,15.91 arc(13.1,16.18) 13.59,16.28 16.3,16.28 arc(16.79,16.38) 17.2,16.65 18.28,17.73 arc(18.33,17.81) 18.35,17.91 v1(18.35,18.16) ; C2.1 v1(16.45,17.22)
  Bottom Layer w0.254: v1(11.3,10.8) 11.03,10.8 arc(10.93,10.81) 10.85,10.87 9.8,11.92 arc(9.61,12.2) 9.54,12.53 9.54,14.47 arc(9.64,14.95) 9.92,15.36 11.99,17.44 arc(12.2,17.76) 12.28,18.13 12.28,18.6 arc(12.26,18.7) 12.21,18.78 12.08,18.91 arc(11.99,18.97) 11.9,18.99 11.74,19.14 v1(11.59,19.14)
  Bottom Layer w0.348: v1(14.03,18.99) 13.61,18.56 arc(13.5,18.4) 13.46,18.2 13.46,17.29 arc(13.37,16.8) 13.09,16.39 11.38,14.68 arc(11.32,14.6) 11.3,14.5 v1(11.3,14.22)
  vias: v1(3.81,51.23) v1(3.81,50.44) v1(3.81,49.15) v1(3.81,47.63) v1(3.81,46.67) v1(4.06,2.22) v1(4.06,0.95) v1(4.95,41.28) v1(5.33,0.95) v1(5.46,46.48) v1(6.6,0.95) v1(6.86,46.48) v1(7.3,18.42) v1(7.3,17.65) v1(7.3,16.89) v1(7.87,27.62) v1(7.79,11.18) v1(7.81,9.91) v1(7.87,2.22) v1(7.87,0.95) v1(8.03,46.51) v1(8.14,38.11) v1(8.19,13.34) v1(8.19,12.07) v1(8.25,19.18) v1(8.64,38.61) v1(8.65,37.6) v1(8.76,46.23) v1(8.7,9.27) v1(9.14,39.12) v1(9.15,38.11) v1(9.16,37.1) v1(9.14,2.22) v1(9.14,0.95) v1(9.65,39.63) v1(9.65,38.62) v1(9.66,37.61) v1(9.67,36.6) v1(9.78,19.18) v1(9.91,46.36) v1(9.97,41.91) v1(10.03,42.8) v1(10.15,40.14) v1(10.15,39.13) v1(10.16,38.12) v1(10.17,37.11) v1(10.17,36.1) v1(10.41,43.56) v1(10.41,16.19) v1(10.41,2.22) v1(10.41,0.95) v1(10.54,42.16) v1(10.66,39.64) v1(10.66,38.63) v1(10.67,37.62) v1(10.67,36.61) v1(10.8,42.93) v1(11.05,46.36) v1(11.05,24.38) v1(11.16,39.14) v1(11.17,38.13) v1(11.18,37.12) v1(11.67,38.63) v1(11.68,37.62) v1(11.68,2.22) v1(11.68,0.95) v1(12.18,38.13) v1(12.7,44.58) v1(12.95,2.22) v1(12.95,0.95) v1(13.21,46.36) v1(13.97,46.36) v1(14.22,0.95) v1(14.99,46.36) v1(15.11,24.38) v1(15.17,21.41) v1(15.49,0.95) v1(15.88,46.36) v1(16,2.29) v1(16.64,0.89) v1(16.74,51.26) v1(16.76,50.35) v1(16.76,49.21) v1(16.76,48.13) v1(16.76,47.31) v1(16.76,18.73) v1(16.76,13.65) v1(16.76,9.84) v1(16.76,8.57) v1(16.76,7.3) v1(17.02,46.1)
NRST: length 43.5
  Top Layer w0.152: 15.12,18.09 15.35,18.09 ; 15.12,18.09 R1.1 14.88,18.09 arc(15.05,18.16) 15.12,18.32 ; 15.12,18.09 15.12,18.32 ; 15.35,18.09 15.75,18.09 ; 15.35,18.09 arc(15.18,18.15) 15.12,18.32 ; v1(14.16,29.72) 14.16,20.63 arc(14.25,20.42) 14.46,20.34 SW3.1 15.12,18.32 ; 11.75,39.97 12.46,40.68 v1(12.58,40.68)
  Bottom Layer w0.152: 19.05,49.96 18.28,49.96 arc(17.97,49.83) 17.84,49.52 17.84,40.1 arc(17.74,39.6) 17.46,39.18 16.73,38.45 arc(16.49,38.28) 16.2,38.23 15.77,38.23 arc(15.51,38.18) 15.3,38.03 15.15,37.88 ; 14.99,37.72 14.83,37.56 ; 14.99,37.72 14.83,37.88 ; 14.99,37.72 15.15,37.88 ; 14.83,37.56 14.83,37.88 ; 14.83,37.56 14.38,37.12 arc(14.22,36.87) 14.16,36.58 v1(14.16,29.72) ; 14.83,37.88 12.58,40.13 v1(12.58,40.68) ; 14.83,37.88 15.15,37.88
OSC32_IN: length 5.3
  Top Layer w0.152: X3.1 15.42,40.2 15.42,40.78 arc(15.28,41.11) 14.94,41.25 13.57,41.25 arc(13.4,41.18) 13.33,41.01 13.33,40.26 arc(13.22,39.99) 12.95,39.88 arc(12.81,39.85) 12.68,39.77 U1.4
OSC32_OUT: length 5.1
  Top Layer w0.152: U1.5 12.38,40.03 arc(12.54,40.14) 12.72,40.17 arc(12.97,40.27) 13.07,40.52 13.07,41.21 arc(13.1,41.35) 13.18,41.47 13.86,42.15 C47.1 13.98,42.29 14.96,42.29 X3.2
PA0_WKUP0: length 23.1
  Top Layer w0.152: R9.1 8.56,33.45 arc(8.25,33.33) 8.13,33.02 v1(8.13,32.26) ; U1.16 7.88,40.09 arc(7.66,40.23) 7.41,40.28 5.4,40.28 arc(4.9,40.38) 4.49,40.66 v1(3.87,41.28)
  Bottom Layer w0.152: 3.73,33.07 3.87,33.21 ; 3.73,33.07 4.02,33.07 ; 3.73,33.07 2.84,32.18 J4.13 ; 3.87,33.21 v1(3.87,41.28) ; 3.87,33.21 4.02,33.07 ; 4.02,33.07 4.83,32.26 v1(8.13,32.26)
PA1: length 15
  Top Layer w0.152: U1.17 7.63,39.78 arc(7.46,39.89) 7.25,39.93 4.86,39.93 arc(4.31,40.04) 3.85,40.35 3.17,41.03 arc(2.8,41.58) 2.67,42.23 2.67,48.21 arc(2.6,48.54) 2.41,48.82 J4.20
PA2: length 7.7
  Top Layer w0.152: U1.18 7.38,39.46 arc(7.2,39.58) 6.98,39.62 4.39,39.62 arc(4.02,39.7) 3.7,39.91 J4.17
PA3: length 7.4
  Top Layer w0.152: U1.19 7.19,39.08 arc(7.01,39.2) 6.8,39.24 2.5,39.24 arc(1.88,39.37) 1.35,39.72 J4.16 0.38,39.8
PA4: length 7
  Top Layer w0.152: 7,38.4 7,38.66 6.98,38.67 ; 7,38.4 U1.20 ; 7,38.4 6.89,38.29 2.73,38.29 arc(2.33,38.21) 1.99,37.98 J4.15 ; 7,38.4 7.3,38.4 7.33,38.37
PA5: length 10
  Top Layer w0.152: J4.14 2.02,34.72 arc(2.3,34.84) 2.41,35.12 2.41,37.21 arc(2.62,37.71) 3.11,37.91 6.88,37.91 7.06,37.73 ; U1.21 7.06,37.73 ; 7.06,37.73 7.01,37.78 7.26,37.78 7.29,37.8 ; 7,37.78 7,37.49 6.99,37.49
PA6: length 14.7
  Top Layer w0.152: 7.44,37.35 7.17,37.08 6.69,37.08 6.31,37.47 3.3,37.47 arc(2.9,37.3) 2.73,36.89 2.73,30.15 arc(2.58,29.79) 2.22,29.64 J4.12 0.38,29.64
PA7: length 16.8
  Top Layer w0.152: U1.23 7.36,36.7 6.95,36.7 arc(6.73,36.75) 6.54,36.87 6.51,36.91 arc(6.31,37.04) 6.08,37.08 3.56,37.08 arc(3.2,36.94) 3.05,36.58 3.05,27.82 arc(2.84,27.31) 2.33,27.1 J4.11 J4.11
PA9: length 21.7
  Top Layer w0.152: U1.32 12.44,33.84 arc(12.64,33.7) 12.88,33.66 12.97,33.66 arc(13.21,33.61) 13.4,33.48 13.46,33.42 arc(13.58,33.24) 13.63,33.02 13.63,32.59 arc(13.67,32.37) 13.8,32.18 14.14,31.83 arc(14.37,31.68) 14.64,31.62 15.46,31.62 arc(15.71,31.57) 15.91,31.44 arc(16.07,31.2) 16.13,30.91 16.13,20.03 arc(16.29,19.64) 16.67,19.48 19.05,19.48
PA10: length 19
  Top Layer w0.152: 11.19,35.65 12.73,34.11 arc(12.89,34) 13.08,33.96 13.25,33.96 arc(13.45,33.92) 13.63,33.8 13.88,33.55 arc(14,33.38) 14.04,33.17 14.04,32.71 arc(14.09,32.46) 14.23,32.25 14.26,32.22 arc(14.5,32.06) 14.78,32 15.6,32 arc(15.93,31.94) 16.2,31.75 16.42,31.54 arc(16.58,31.3) 16.64,31.01 16.64,22.82 arc(16.87,22.25) 17.43,22.02 19.05,22.02
PA11: length 16.5
  Top Layer w0.152: U1.34 12.91,34.49 arc(13.15,34.33) 13.43,34.28 ; 19.05,24.56 17.81,24.56 arc(17.25,24.79) 17.02,25.36 17.02,31.34 arc(16.97,31.6) 16.81,31.83 16.5,32.14 arc(16.32,32.41) 16.26,32.74 16.26,33.27 arc(16.14,33.54) 15.88,33.66 14.79,33.66 arc(14.46,33.72) 14.19,33.9 14.09,34.01 arc(13.78,34.21) 13.43,34.28
PA12: length 14
  Top Layer w0.152: 11.75,36.22 13.17,34.8 arc(13.43,34.63) 13.74,34.57 13.99,34.57 arc(14.24,34.52) 14.46,34.37 14.63,34.2 arc(14.81,34.08) 15.02,34.04 16.13,34.04 arc(16.5,33.88) 16.66,33.51 16.66,32.96 arc(16.72,32.66) 16.88,32.41 17.09,32.2 arc(17.27,31.93) 17.34,31.62 17.34,27.9 arc(17.57,27.33) 18.13,27.1 19.05,27.1
PA15: length 31.4
  Top Layer w0.152: U1.2 13.24,39.2 13.51,39.2 14.12,38.58 arc(14.38,38.41) 14.67,38.35 17.62,38.35 arc(17.93,38.29) 18.19,38.12 19.05,37.26 ; 9.25,31.17 9.07,30.99 H1.5
  Bottom Layer w0.152: H1.5 8.04,29.17 arc(8.42,28.92) 8.87,28.83 14.73,28.83 arc(15,28.94) 15.11,29.21 15.11,35.96 arc(15.33,36.48) 15.86,36.7 18.49,36.7 19.05,37.26
PB0: length 19.5
  Top Layer w0.152: U1.24 7.54,36.32 6.95,36.32 arc(6.75,36.36) 6.58,36.48 6.51,36.55 arc(6.34,36.66) 6.14,36.7 3.81,36.7 arc(3.5,36.57) 3.37,36.26 3.37,25.53 arc(3.08,24.84) 2.4,24.56 J4.10 0.38,24.56
PB1_BOOT1: length 20.5
  Top Layer w0.152: 0.38,22.02 1.06,22.02 arc(1.25,22.06) 1.42,22.17 3.25,24 arc(3.52,24.41) 3.62,24.9 3.62,34.99 arc(3.79,35.41) 4.21,35.58 5.84,35.58 arc(5.99,35.64) 6.05,35.79 R3.2 6.24,35.94 7.44,35.94 arc(7.7,35.99) 7.93,36.14 U1.25
PB2: length 23
  Top Layer w0.152: U1.26 7.95,35.6 ; 0.38,19.48 J4.8 2.15,19.48 arc(2.47,19.61) 2.6,19.93 2.6,22.02 arc(2.7,22.5) 2.98,22.91 3.56,23.5 arc(3.84,23.92) 3.94,24.4 3.94,34.79 arc(4.09,35.15) 4.45,35.31 7.24,35.31 arc(7.62,35.38) 7.95,35.6
PB3: length 35.4
  Top Layer w0.152: U1.36 13.44,35.1 arc(13.67,34.95) 13.93,34.89 14.32,34.89 arc(14.61,34.84) 14.86,34.67 arc(15.14,34.48) 15.47,34.42 16.51,34.42 arc(16.9,34.26) 17.06,33.87 17.06,33.28 arc(17.11,32.97) 17.29,32.72 17.47,32.53 arc(17.61,32.33) 17.65,32.1 17.65,30.31 arc(17.85,29.84) 18.32,29.64 19.05,29.64 ; R29.2 8.81,20.01 arc(8.33,20.22) 8.13,20.7 8.13,22.54 arc(7.98,22.89) 7.63,23.04 6.55,23.04 arc(6.32,23.13) H1.2
  Bottom Layer w0.152: H1.2 15.37,23.37 arc(16.53,23.85) 17.02,25.02 17.02,28.91 arc(17.23,29.43) 17.74,29.64 19.05,29.64
PB4: length 9.2
  Top Layer w0.152: 12.32,36.79 13.67,35.43 arc(13.93,35.26) 14.22,35.2 14.71,35.2 arc(14.95,35.15) 15.14,35.02 arc(15.39,34.86) 15.68,34.8 16.89,34.8 arc(17.34,34.61) 17.53,34.16 17.53,33.52 arc(17.6,33.18) 17.79,32.88 18.49,32.18 19.05,32.18
PB11: length 25.5
  Top Layer w0.152: 0.38,16.94 J4.7 J4.7 2.39,16.94 arc(2.81,17.12) 2.98,17.54 2.98,21.64 arc(3.08,22.12) 3.36,22.53 3.88,23.06 arc(4.16,23.47) 4.25,23.96 4.25,34.42 arc(4.42,34.81) 4.81,34.98 7.28,34.98 arc(7.84,35.09) 8.32,35.41 U1.27
PB12: length 28.1
  Top Layer w0.152: 0.38,14.4 J4.6 2.68,14.4 arc(3.16,14.6) 3.37,15.09 3.37,21.38 arc(3.46,21.87) 3.74,22.28 4.2,22.74 arc(4.48,23.15) 4.57,23.64 4.57,34.19 arc(4.71,34.53) 5.05,34.67 7.71,34.67 arc(8.12,34.75) 8.47,34.98 U1.28
PB13: length 29.5
  Top Layer w0.152: 9.42,35.37 7.91,33.86 arc(7.69,33.54) 7.62,33.17 7.62,32.77 arc(7.47,32.41) 7.11,32.26 5.69,32.26 arc(5.12,32.02) 4.89,31.46 4.89,23.32 arc(4.79,22.84) 4.52,22.42 4.12,22.03 arc(3.84,21.61) 3.75,21.13 3.75,12.8 arc(3.48,12.14) 2.83,11.87 0.65,11.87 J4.5
PC8_BOOT0: length 30.1
  Top Layer w0.152: 13.32,38.66 13.34,38.64 13.34,38.38 ; 13.34,38.38 13.32,38.4 ; 13.34,38.38 13.6,38.12 arc(13.78,38) 13.99,37.96 17.36,37.96 arc(17.81,37.77) 18,37.32 18,36.08 arc(18.05,35.8) 18.21,35.56 19.05,34.72 ; SW1.3 10.62,24.84 arc(10.48,24.52) 10.16,24.38 v1(10.03,24.38) 9.53,24.38 arc(9.33,24.47) 9.25,24.66 R4.1 ; 13.32,38.4 13.08,38.4 ; 13.32,38.4 U1.1
  Bottom Layer w0.152: 19.05,34.72 17.23,34.72 arc(16.72,34.51) 16.51,34 16.51,25.91 arc(16.27,25.33) 15.7,25.1 10.74,25.1 v1(10.03,24.38)
PC13: length 37.1
  Top Layer w0.152: R26.2 11.71,17.22 arc(11.53,17.29) 11.46,17.48 11.46,18.19 arc(11.4,18.49) 11.23,18.75 arc(11.11,18.91) 11.07,19.11 11.07,19.2 arc(11.11,19.38) 11.21,19.53 11.37,19.69 arc(11.6,20.01) 11.68,20.4 11.68,29.42 arc(11.66,29.52) 11.61,29.6 v1(11.49,29.72) ; U1.3 12.83,39.35 arc(12.99,39.46) 13.18,39.5 13.41,39.5 arc(13.58,39.46) 13.71,39.37 14.3,38.79 arc(14.5,38.65) 14.73,38.61 17.59,38.61 arc(17.84,38.66) 18.04,38.79 19.05,39.8
  Bottom Layer w0.152: v1(11.49,29.72) 11.92,29.3 arc(12.08,29.19) 12.28,29.15 14.28,29.15 arc(14.62,29.29) 14.76,29.62 14.76,36.6 arc(14.8,36.84) 14.94,37.04 15.56,37.66 arc(15.8,37.82) 16.09,37.88 16.44,37.88 arc(16.77,37.94) 17.04,38.13 18.72,39.8 19.05,39.8
PU: length 7.4
  Top Layer w0.152: R2.1 C1.2 14.85,44.09 arc(14.63,43.95) 14.39,43.9 13.7,43.9 arc(13.38,43.77) 13.25,43.45 13.25,42.75 arc(13.2,42.5) 13.06,42.29 12.78,42.01 arc(12.66,41.83) 12.62,41.63 arc(12.58,41.42) 12.46,41.24 ; 12.46,41.24 U1.7
RF: length 2.3
  Top Layer w0.241: 11.18,41.65 U1.10
  Top Layer w0.348: 11.18,41.65 11.47,41.94 arc(11.49,41.98) 11.5,42.02 11.79,42.31 arc(11.96,42.56) L6.2
SWCLK: length 24.2
  Top Layer w0.152: H1.4 8.57,28.45 arc(8.89,28.38) 9.16,28.2 R30.2 ; U1.39 13.83,36.4 arc(13.88,36.33) 13.91,36.24 ; 13.91,36.24 13.91,36.22 ; 13.91,36.24 arc(13.91,36.23) 13.91,36.22 arc(13.92,36.15) 13.96,36.09 arc(13.96,36.08) 13.97,36.08 14.06,35.98 arc(14.25,35.86) 14.47,35.81 15.76,35.81 arc(15.98,35.86) 16.17,35.99 v1(16.26,36.07)
  Bottom Layer w0.152: H1.4 14.86,28.45 arc(15.31,28.63) 15.49,29.08 15.49,34.88 arc(15.57,35.27) 15.8,35.61 v1(16.26,36.07)
SWDIO: length 31.1
  Top Layer w0.152: v1(17.46,36.07) 16.79,35.4 arc(16.55,35.24) 16.27,35.18 15.81,35.18 arc(15.56,35.23) 15.35,35.37 arc(15.18,35.48) 14.99,35.52 14.37,35.52 arc(14.16,35.56) 13.99,35.68 U1.38 ; H1.3 7.72,25.91 arc(8.04,25.77) 8.18,25.45 8.18,23.8 arc(8.27,23.58) 8.48,23.5 9.19,23.5 arc(9.23,23.51) R27.2
  Bottom Layer w0.152: H1.3 14.92,25.91 arc(15.68,26.23) 16,26.99 16,34.06 arc(16.1,34.57) 16.39,35 v1(17.46,36.07)
USART0_RX: length 39.3
  Top Layer w0.241: U2.6 11.01,12.7 arc(11.1,12.68) 11.19,12.63 v1(11.3,12.51) 11.48,12.33 arc(11.56,12.27) 11.66,12.26 11.77,12.26 arc(11.87,12.27) 11.95,12.33 12.09,12.48 arc(12.2,12.64) 12.24,12.83 12.24,14.35 arc(12.34,14.83) 12.62,15.25 12.86,15.5 arc(13.28,15.77) 13.76,15.87 16.57,15.87 arc(17.05,15.96) 17.47,16.24 18.02,16.79 arc(18.18,16.9) 18.38,16.94 19.05,16.94 ; v1(13.27,19.43) 13.1,19.6 arc(13.05,19.68) 13.03,19.78 13.03,32.28 arc(12.96,32.65) 12.75,32.96 U1.31
  Bottom Layer w0.241: v1(11.3,12.51) 11.13,12.34 arc(11.05,12.28) 10.95,12.26 10.67,12.26 arc(10.57,12.28) 10.49,12.34 10.36,12.46 arc(10.31,12.54) 10.29,12.64 10.29,14.39 arc(10.34,14.66) 10.5,14.89 10.68,15.07 arc(10.84,15.18) 11.04,15.22 11.28,15.22 11.4,15.34 11.4,15.8 11.54,15.94 11.99,15.94 12.12,16.07 12.12,16.51 12.26,16.66 12.69,16.66 12.84,16.8 12.84,17.13 arc(12.86,17.23) 12.91,17.31 12.95,17.35 arc(13,17.43) 13.02,17.53 13.02,19.08 arc(13.04,19.18) 13.1,19.26 v1(13.27,19.43)
USART0_TX: length 39.6
  Top Layer w0.241: 19.05,14.4 18.38,14.4 arc(18.18,14.44) 18.02,14.55 17.47,15.1 arc(17.05,15.38) 16.57,15.47 13.92,15.47 arc(13.44,15.38) 13.03,15.1 13.01,15.08 arc(12.73,14.67) 12.64,14.19 12.64,12.67 arc(12.6,12.48) 12.49,12.31 12.19,12.01 arc(12.02,11.9) 11.83,11.86 11.65,11.86 arc(11.55,11.84) 11.47,11.79 v1(11.3,11.62) 11.19,11.5 arc(11.1,11.45) 11.01,11.43 U2.7 ; U1.30 10.02,34.76 10.32,34.76 12.46,32.63 arc(12.59,32.43) 12.64,32.2 12.64,19.79 arc(12.62,19.69) 12.56,19.61 v1(12.38,19.43)
  Bottom Layer w0.241: v1(12.38,19.43) 12.56,19.26 arc(12.61,19.18) 12.63,19.08 12.63,18.11 arc(12.53,17.62) 12.26,17.21 10.16,15.12 arc(9.96,14.82) 9.89,14.47 9.89,12.52 arc(9.92,12.38) 9.99,12.27 10.25,12.02 arc(10.41,11.91) 10.61,11.87 10.95,11.87 arc(11.05,11.85) 11.13,11.79 v1(11.3,11.62)
USB_D+: length 9.4
  Top Layer w0.241: U2.1 14.05,10.16 arc(13.86,10.2) 13.69,10.31 13.61,10.39 arc(13.45,10.5) 13.25,10.54 12.91,10.54 arc(12.42,10.44) 12.01,10.17 11.23,9.39 arc(10.95,8.98) 10.86,8.49 10.86,7.93 10.91,7.87 10.91,6.48 arc(10.89,6.38) 10.84,6.3 ; 9.91,7.2 9.91,6.35 10.03,6.22 10.66,6.22 arc(10.75,6.24) 10.83,6.3
USB_D-: length 9.5
  Top Layer w0.241: 10.46,8.44 10.45,8.45 9.69,8.45 arc(9.6,8.43) 9.51,8.37 9.48,8.34 arc(9.43,8.26) 9.41,8.16 9.41,7.2 ; 10.46,8.44 10.46,8.97 arc(10.5,9.16) 10.61,9.33 11.85,10.56 arc(12.26,10.84) 12.75,10.93 13.24,10.93 arc(13.44,10.97) 13.6,11.08 13.8,11.28 arc(13.96,11.39) 14.16,11.43 U2.2 ; 10.46,8.44 10.46,7.93 10.41,7.87 10.41,7.2
XTAL_IN: length 7.9
  Top Layer w0.152: X1.1 5.59,44.11 arc(5.75,44) 5.94,43.97 6.84,43.97 arc(7.05,44.01) 7.22,44.13 C17.2 7.49,44.32 8.03,43.78 arc(8.22,43.51) 8.28,43.18 8.28,41.62 arc(8.32,41.41) 8.45,41.22 9.14,40.53
XTAL_OUT: length 5.1
  Top Layer w0.152: U1.14 8.2,40.9 arc(8.07,41.09) 8.03,41.33 8.03,42.69 arc(7.99,42.88) 7.88,43.05 7.57,43.36 C18.1 6.55,43.36 6.19,42.99
$1N2903: length 9.6
  Top Layer w0.152: R8.1 15.88,8.88 arc(15.78,9.11) 15.55,9.21 12.37,9.21 arc(12.05,9.07) 11.91,8.75 11.91,7.2
$1N2915: length 8.7
  Top Layer w0.152: 8.91,7.2 8.91,8.07 arc(8.89,8.16) 8.84,8.25 v1(8.7,8.38) ; R7.1 v1(4.4,8.38) 4.44,8.38
  Bottom Layer w0.152: v1(4.4,8.38) v1(8.7,8.38)
$1N28047: length 1.3
  Top Layer w0.152: PWR1.2 9.62,18.19 R13.1
$1N28050: length 1.3
  Top Layer w0.152: LED1.2 13.18,18.09 R26.1
$1N31252: length 2.8
  Top Layer w0.152: SW2.3 10.62,31.27 arc(10.51,31.52) 10.26,31.62 9.93,31.62 arc(9.69,31.67) 9.48,31.81 9.4,31.89 arc(9.29,32.06) 9.25,32.26 R9.2
$1N47923: length 4.9
  Top Layer w0.348: R31.2 12.01,46.29 arc(12.02,46.3) 12.02,46.3 12.02,48.77 arc(12.18,49.59) L4.1
$1N51376: length 1.6
  Top Layer w0.348: L6.1 12.01,44.26 arc(12.01,44.27) C57.2 12.01,45.03 arc(12.01,45.04) R31.1

## Copper pours and planes (outline as drawn; the poured copper is in the pictures)
3V3 on Top Layer: 6.17,14.89 6.17,18.71 7.18,19.72 7.18,21.75 6.88,22.05 4.72,22.05 4.31,21.65 4.31,15.12 4.75,14.68 5.97,14.68
+5V on Top Layer: 7.37,7.87 7.11,8.13 5.08,8.13 4.19,9.02 4.19,14.15 4.65,14.61 7.49,14.61 7.75,14.35 7.75,12.19 7.62,12.07 6.99,12.07 6.86,12.19 6.86,13.34 6.73,13.46 5.84,13.46 5.72,13.34 5.72,12.19 6.48,11.43 6.48,9.63 6.7,9.41 7.86,9.41 8.13,9.14 8.13,6.6 8.64,6.1 11.68,6.1 12.19,6.6 12.19,8.38 12.46,8.65 13.86,8.65 13.97,8.54 13.97,8.26 13.84,8.13 13.08,8.13 12.86,7.91 12.86,5.49 12.06,4.7 7.87,4.7 7.37,5.21
GND on Top Layer: 0,52 20.32,52 20.32,0 0,0
GND on Bottom Layer: 0,52 20.32,52 20.32,0 0,0
GND on GND: 0.26,51.74 20.06,51.74 20.06,0.26 0.26,0.26
GND on POWER: 0,52 20.32,52 20.32,0 0,0

Small or netless copper shapes (teardrops, artwork), in the pictures only: 281 on Top Layer, 35 on Bottom Layer, 62 on POWER
